# Altium schematic sheet Peripherials.SchDoc
size A4; SheetNumber: 7; SheetTotal: 7
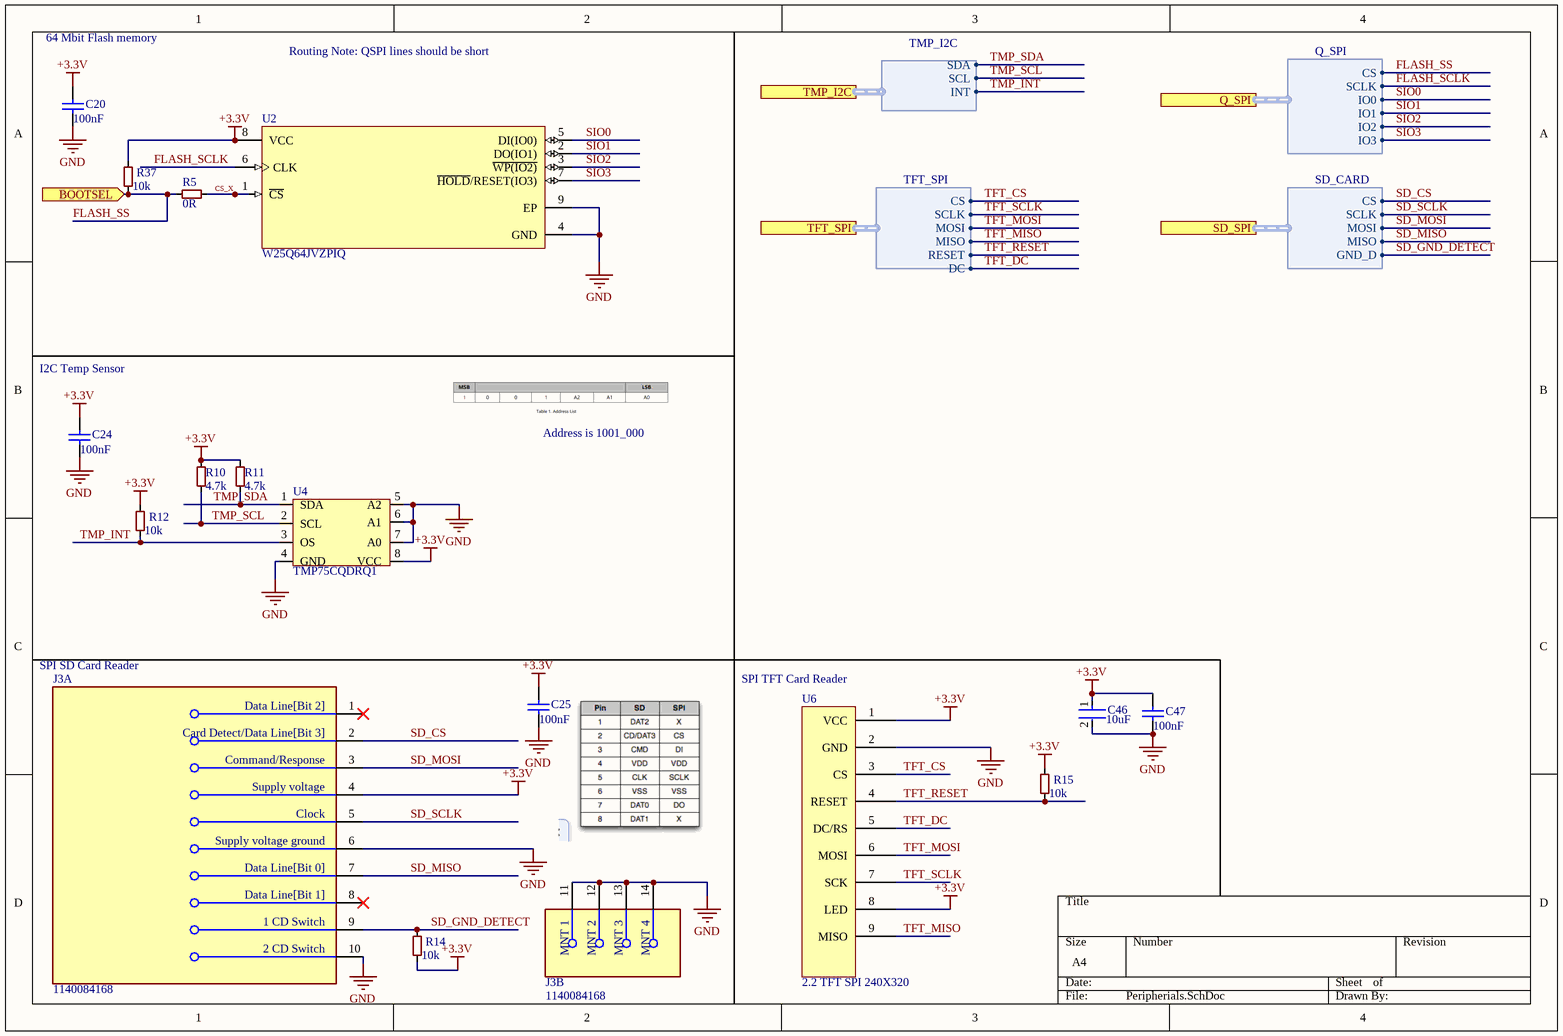
[diagram p0: Peripherials.SchDoc]

## Parts
C20  Capacitance: 100nF  [CAPC1050X55X23ML05T13]  (hidden comment: CL05B104KO5NNNC)
C24  Capacitance: 100nF  [CAPC1050X55X23ML05T13]  (hidden comment: CL05B104KO5NNNC)
C25  Capacitance: 100nF  [CAPC1050X55X23ML05T13]  (hidden comment: CL05B104KO5NNNC)
C46  Capacitance: 10uF  [FP-CL21-IPC_A]  (hidden comment: CL21A106KAYNNNE)
C47  Capacitance: 100nF  [CAPC1050X55X23ML05T13]  (hidden comment: CL05B104KO5NNNC)
J3  1140084168  [FP-1140084168-0]  (parts A,B of 2)
R5  R: 0R  [0402 Resistor]  (hidden comment: FRC0402F0000TS)
R10  R: 4.7k  [0402 Resistor]  (hidden comment: FRC0402F4701TS)
R11  R: 4.7k  [0402 Resistor]  (hidden comment: FRC0402F4701TS)
R12  R: 10k  [0402 Resistor]  (hidden comment: FRC0402F1002TS)
R14  R: 10k  [0402 Resistor]  (hidden comment: FRC0402F1002TS)
R15  R: 10k  [0402 Resistor]  (hidden comment: FRC0402F1002TS)
R37  R: 10k  [0402 Resistor]  (hidden comment: FRC0402F1002TS)
U2  W25Q64JVZPIQ  [FP-ZP-MFG]
U4  TMP75CQDRQ1  [TMP75CQDRQ1]
U6  2.2 TFT SPI 240X320  [TFT 2.2 LCD Display]

## Ports
BOOTSEL (in, see Top_Level[3B], Connectors[4A]), Q_SPI (harness Q_SPI, see Top_Level[3B], RP2350[1C]), SD_SPI (harness SD_CARD, see Top_Level[3B], RP2350[1A]), TFT_SPI (harness TFT_SPI, see Top_Level[3C], RP2350[1B]), TMP_I2C (harness TMP_I2C, see Top_Level[3B], RP2350[1B])

## Harnesses
Q_SPI: CS, SCLK, IO0, IO1, IO2, IO3
SD_CARD: CS, SCLK, MOSI, MISO, GND_D
TMP_I2C: SDA, SCL, INT
TFT_SPI: CS, SCLK, MOSI, MISO, RESET, DC

## Nets
+3.3V: C20.2 C24.2 C25.2 C46.1 C47.2 J3.4(Supply_voltage) R10.2 R11.2 R12.2 R14.1 R15.2 R37.2 U2.8(VCC) U4.8(VCC) U6.1(VCC) U6.8(LED)
GND: C20.1 C24.1 C25.1 C46.2 C47.1 J3.6(Supply_voltage_ground) J3.10(2_CD_Switch) J3.11(MNT_1) J3.12(MNT_2) J3.13(MNT_3) J3.14(MNT_4) U2.4(GND) U2.9(EP) U4.4(GND) U4.5(A2) U4.6(A1) U4.7(A0) U6.2(GND)
CS_X: R5.1 U2.1(~{CS})
FLASH_SCLK: U2.6(CLK) ; port Q_SPI.SCLK
FLASH_SS: R5.2 R37.1 ; port BOOTSEL, port Q_SPI.CS
SD_CS: J3.2(Card_Detect/Data_Line[Bit_3]) ; port SD_SPI.CS
SD_GND_DETECT: J3.9(1_CD_Switch) R14.2 ; port SD_SPI.GND_D
SD_MISO: J3.7(Data_Line[Bit_0]) ; port SD_SPI.MISO
SD_MOSI: J3.3(Command/Response) ; port SD_SPI.MOSI
SD_SCLK: J3.5(Clock) ; port SD_SPI.SCLK
SIO0: U2.5(DI(IO0)) ; port Q_SPI.IO0
SIO1: U2.2(DO(IO1)) ; port Q_SPI.IO1
SIO2: U2.3(~{WP(IO2)}) ; port Q_SPI.IO2
SIO3: U2.7(~{HOLD}/RESET(IO3)) ; port Q_SPI.IO3
TFT_CS: U6.3(CS) ; port TFT_SPI.CS
TFT_DC: U6.5(DC/RS) ; port TFT_SPI.DC
TFT_MISO: U6.9(MISO) ; port TFT_SPI.MISO
TFT_MOSI: U6.6(MOSI) ; port TFT_SPI.MOSI
TFT_RESET: R15.1 U6.4(RESET) ; port TFT_SPI.RESET
TFT_SCLK: U6.7(SCK) ; port TFT_SPI.SCLK
TMP_INT: R12.1 U4.3(OS) ; port TMP_I2C.INT
TMP_SCL: R10.1 U4.2(SCL) ; port TMP_I2C.SCL
TMP_SDA: R11.1 U4.1(SDA) ; port TMP_I2C.SDA

Not connected (* = marked no-connect by the designer): J3 1(Data_Line[Bit_2])* 8(Data_Line[Bit_1])*

## Notes on the sheet
- 64 Mbit Flash memory
- Routing Note: QSPI lines should be short
- I2C Temp Sensor
- Address is 1001_000
- SPI SD Card Reader
- (near U6) SPI TFT Card Reader

## Library data of the parts
C20 C24 C25 C47 = CMP-2000-05439-1: Chip Capacitor, 100 nF, +/- 10%, 16 V, -55 to 125 degC, 0402 (1005 Metric), RoHS, Tape and Reel; Manufacturer: Samsung Electro-Mechanics; Dielectric: X7R; Rated Voltage: 16V; Case Size/Dimension: 0402; Tolerance (%): ±10%; Manufacturer URL: http://www.samsungsem.com/global/index.jsp; Datasheet URL: https://datasheet.ciiva.com/29198/458718-da-01-en-vs-kondensator-0402-29198423.pdf; Datasheet Version: Nov-10; LCSC Part #: C1525; Datasheet: https://www.lcsc.com/datasheet/C1525.pdf
C46 = CMP-13271-002975-1: CL21 Series 0805 10uF 25V ±10% Tolerance X5R Multilayer Ceramic Chip Capacitor; Case Code (Imperial): 0805; Length: 2mm; Case/Package: 0805; Packaging: Tape and Reel; Width: 0.049inch; Tolerance: 10%; Mount: Surface Mount; Min Operating Temperature: -55°C; Thickness: 0.057inch; Height: 1.25mm; Dielectric: X5R; Package Quantity: 1; Depth: 1.25mm; Voltage Rating: 25V; Case Code (Metric): 2012; Max Operating Temperature: 85°C; Radiation Hardening: No; LCSC Part #: C15850; Datasheet: https://www.lcsc.com/datasheet/C15850.pdf
J3 = CMP-02360-000003-1: CONN MICRO SD CARD PUSH-PULL R/A; Gender: Receptacle; Number of Contacts: 8; Connector Type: Connector; Pitch: 1.1mm; Lead Free: Lead Free; Housing Material: Polymer; Radiation Hardening: No; Mount: Surface Mount; Depth: 11.45mm; Number of Rows: 1; Height: 1.55mm; Contact Plating: Gold; Package Quantity: 7500; Packaging: Tape and Reel; Termination: SMD/SMT; Length: 15.6mm; Orientation: Right Angle; Flammability Rating: UL94 V-0; Contact Material: Copper Alloy
R5 = FRC0402F0000TS: RES 0Ω ±1% 1/16W 0402; LCSC Part #: C2906858
R10 R11 = FRC0402F4701TS: RES 4.7kΩ ±1% 62.5mW 0402; LCSC Part #: C2906869
R12 R14 R15 R37 = FRC0402F1002TS: RES 10kΩ ±1% 62.5mW 0402; LCSC Part #: C2906861
U2 = CMP-00619-80966617-1: W25Q64JVZPIQ NOR Flash Serial (SPI, Dual SPI, Quad SPI) 3V/3.3V 64M-bit 8M x 8 6ns 8-Pin WSON EP T/R/Tray/Tube; Memory Size: 8MB; Max Supply Voltage: 3.6V; Min Supply Voltage: 2.7V; Frequency: 133MHz; NexarPartId: 80966617; Memory Type: FLASH; Height: 800µm; Max Operating Temperature: 85°C; Interface: SPI; Ambient Temperature Range High: 85°C; Min Operating Temperature: -40°C; Schedule B: 8542320070, 8542320070; RoHS: Non-Compliant; Access Time: 6ns; LCSC Part #: C2940197; Datasheet: https://www.lcsc.com/datasheet/C2940197.pdf
U4 = TMP75CQDRQ1: -40℃~+125℃ SMBus ±0.25℃ SOP-8 Analog and Digital Output
U6 = 2.2 TFT SPI 240X320: 2.2 inch TFT SPI Display; Datasheet: https://www.lcdwiki.com/2.2inch_SPI_Module_ILI9341_SKU:MSP2202#Reference_Materials